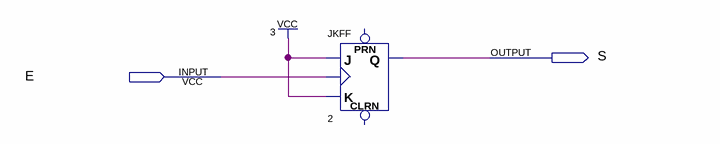
[diagram p0: schematic sheet]
// Quartus schematic div2.bdf as structural Verilog: 1 symbols, 2 pins
module div2 (
  input  E,
  output S
);

  JKFF u_2 (.K(1'b1), .J(1'b1), .CLK(E), .Q(S));  // open: PRN, CLRN
endmodule
